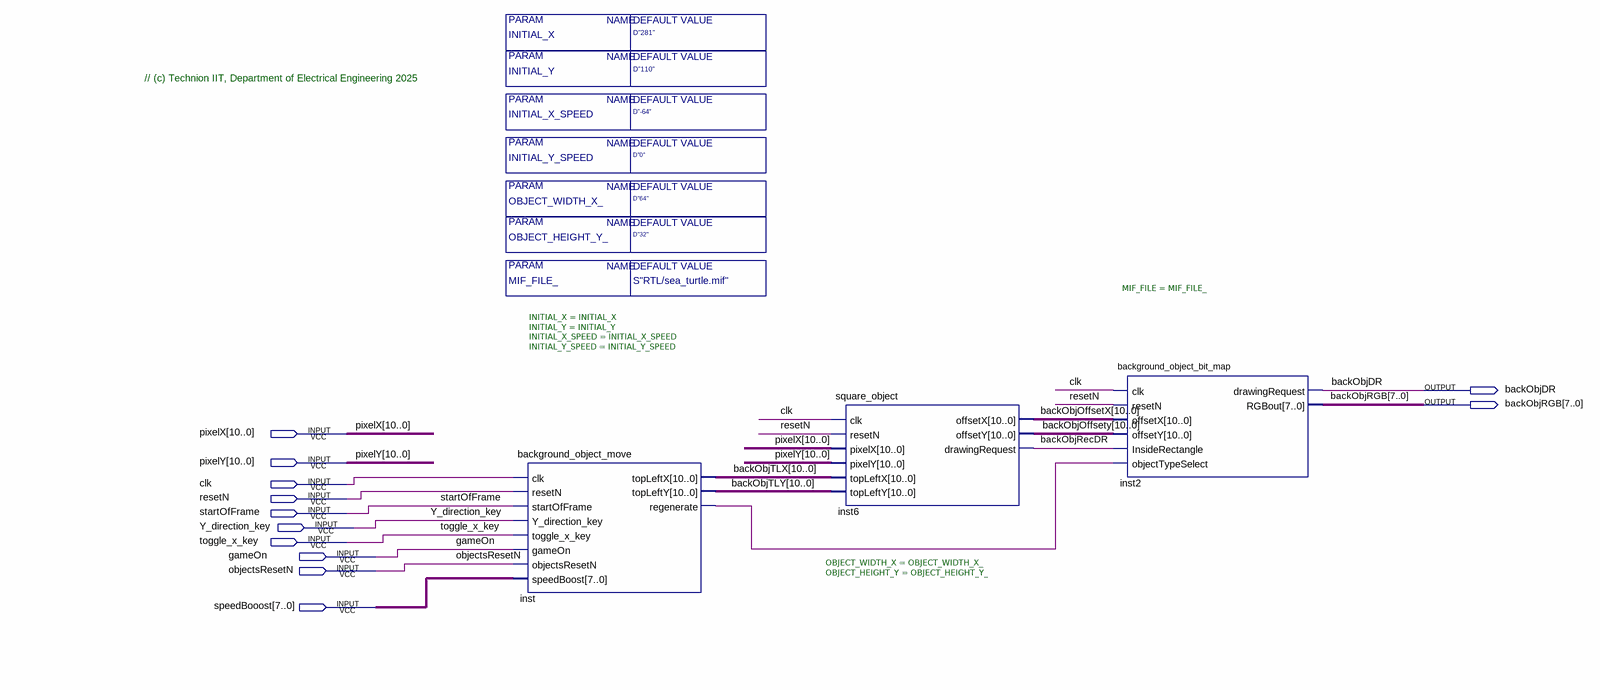
[diagram p0: schematic sheet]
// Quartus schematic Background_Object_Block_T.bdf as structural Verilog: 3 symbols, 12 pins
module Background_Object_Block_T #(parameter INITIAL_X_SPEED = "D\"-64\"", parameter INITIAL_Y_SPEED = "D\"0\"", parameter INITIAL_X = "D\"281\"", parameter OBJECT_WIDTH_X_ = "D\"64\"", parameter OBJECT_HEIGHT_Y_ = "D\"32\"", parameter INITIAL_Y = "D\"110\"", parameter MIF_FILE_ = "S\"RTL/sea_turtle.mif\"") (
  input  [10:0] pixelX,
  input  [10:0] pixelY,
  input  clk,
  input  resetN,
  input  startOfFrame,
  input  Y_direction_key,
  input  toggle_x_key,
  input  gameOn,
  input  objectsResetN,
  input  [7:0] speedBooost,
  output backObjDR,
  output [7:0] backObjRGB
);

  wire backObjRecDR, inst_regenerate;
  wire [10:0] backObjOffsetX, backObjOffsety, backObjTLX, backObjTLY;

  background_object_move #(.INITIAL_X(INITIAL_X), .INITIAL_Y(INITIAL_Y), .INITIAL_X_SPEED(INITIAL_X_SPEED), .INITIAL_Y_SPEED(INITIAL_Y_SPEED)) inst (
    .clk(clk), .resetN(resetN), .startOfFrame(startOfFrame), .Y_direction_key(Y_direction_key),
    .toggle_x_key(toggle_x_key), .gameOn(gameOn), .objectsResetN(objectsResetN), .speedBoost(speedBooost),
    .topLeftX(backObjTLX), .topLeftY(backObjTLY), .regenerate(inst_regenerate));
  square_object #(.OBJECT_WIDTH_X(OBJECT_WIDTH_X_), .OBJECT_HEIGHT_Y(OBJECT_HEIGHT_Y_)) inst6 (
    .clk(clk), .resetN(resetN), .pixelX(pixelX), .pixelY(pixelY), .topLeftX(backObjTLX),
    .topLeftY(backObjTLY), .offsetX(backObjOffsetX), .offsetY(backObjOffsety), .drawingRequest(backObjRecDR));
  background_object_bit_map #(.MIF_FILE(MIF_FILE_)) inst2 (
    .clk(clk), .resetN(resetN), .offsetX(backObjOffsetX), .offsetY(backObjOffsety),
    .InsideRectangle(backObjRecDR), .objectTypeSelect(inst_regenerate), .drawingRequest(backObjDR),
    .RGBout(backObjRGB));

  // Notes on the sheet:
  //   // (c) Technion IIT, Department of Electrical Engineering 2025
endmodule
